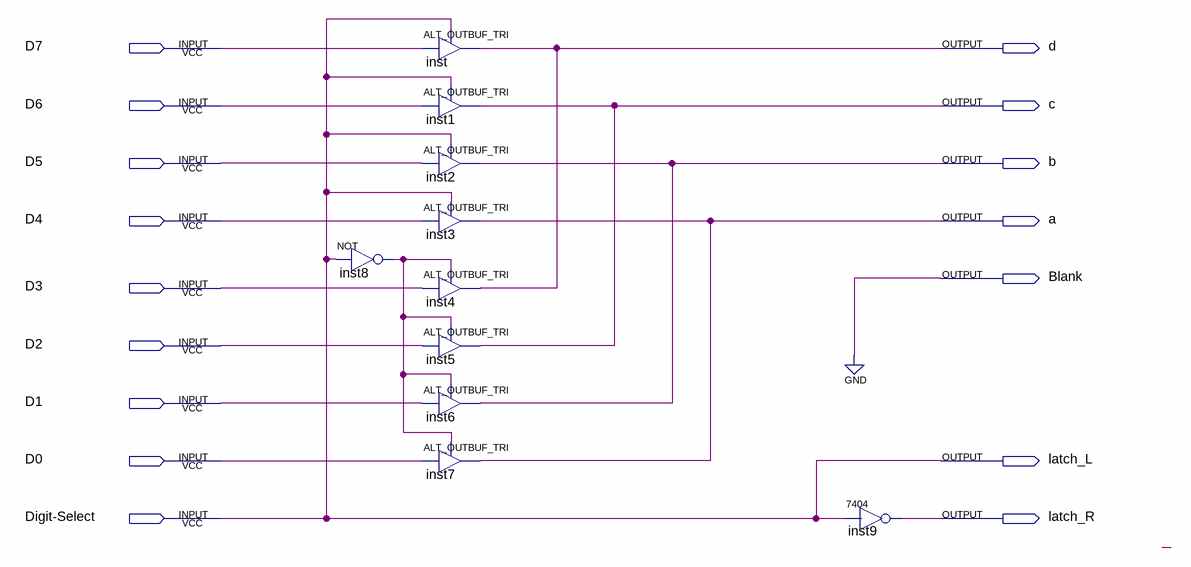
[diagram p0: schematic sheet]
// Quartus schematic Alt-mux.bdf as structural Verilog: 10 symbols, 16 pins
module \Alt-mux  (
  input  D7,
  input  D6,
  input  D5,
  input  D4,
  input  D3,
  input  D2,
  input  D1,
  input  D0,
  input  \Digit-Select ,
  output d,
  output c,
  output b,
  output a,
  output Blank,
  output latch_L,
  output latch_R
);

  wire inst8_out;

  not inst8 (inst8_out, \Digit-Select );
  ALT_OUTBUF_TRI inst (.i(D7), .oe(\Digit-Select ), .o(d));
  ALT_OUTBUF_TRI inst1 (.i(D6), .oe(\Digit-Select ), .o(c));
  ALT_OUTBUF_TRI inst2 (.i(D5), .oe(\Digit-Select ), .o(b));
  ALT_OUTBUF_TRI inst3 (.i(D4), .oe(\Digit-Select ), .o(a));
  ALT_OUTBUF_TRI inst4 (.i(D3), .oe(inst8_out), .o(d));
  ALT_OUTBUF_TRI inst5 (.i(D2), .oe(inst8_out), .o(c));
  ALT_OUTBUF_TRI inst6 (.i(D1), .oe(inst8_out), .o(b));
  ALT_OUTBUF_TRI inst7 (.i(D0), .oe(inst8_out), .o(a));
  \7404  inst9 (.\2 (\Digit-Select ), .\1 (latch_R));

  assign Blank = 1'b0;
  assign latch_L = \Digit-Select ;
endmodule
